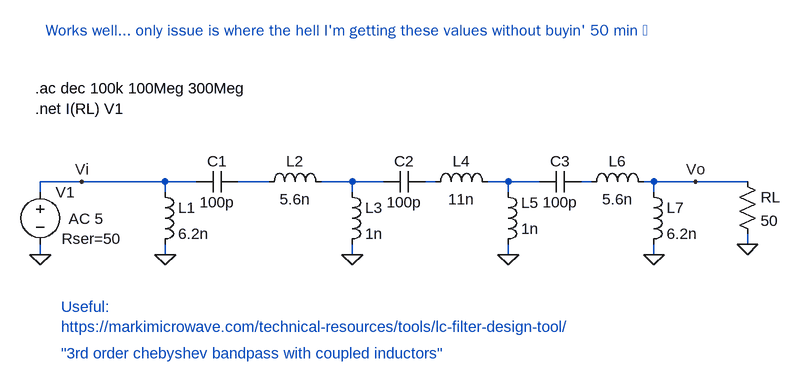
[diagram p0: schematic 2m_vhf_transmitter_bandpass_filter_v1.asc]
2m_vhf_transmitter_bandpass_filter_v1.asc, the LTspice schematic file:
Version 4.1
SHEET 1 1880 808
WIRE 160 528 96 528
WIRE 288 528 160 528
WIRE 336 528 288 528
WIRE 448 528 400 528
WIRE 576 528 528 528
WIRE 624 528 576 528
WIRE 704 528 688 528
WIRE 816 528 784 528
WIRE 864 528 816 528
WIRE 944 528 928 528
WIRE 1040 528 1024 528
WIRE 1104 528 1040 528
WIRE 1184 528 1104 528
WIRE 96 544 96 528
WIRE 288 544 288 528
WIRE 576 544 576 528
WIRE 816 544 816 528
WIRE 1040 544 1040 528
WIRE 1184 624 1184 608
WIRE 96 640 96 624
WIRE 288 640 288 624
WIRE 576 640 576 624
WIRE 816 640 816 624
WIRE 1040 640 1040 624
FLAG 96 640 0
FLAG 1184 624 0
FLAG 160 528 Vi
FLAG 1104 528 Vo
FLAG 288 640 0
FLAG 576 640 0
FLAG 816 640 0
FLAG 1040 640 0
SYMBOL voltage 96 528 R0
WINDOW 123 44 57 Left 2
WINDOW 39 33 88 Left 2
SYMATTR InstName V1
SYMATTR Value ""
SYMATTR Value2 AC 5
SYMATTR SpiceLine Rser=50
SYMBOL res 1168 512 R0
SYMATTR InstName RL
SYMATTR Value 50
SYMBOL ind 272 528 R0
SYMATTR InstName L1
SYMATTR Value 6.2n
SYMBOL cap 400 512 R90
WINDOW 0 0 32 VBottom 2
WINDOW 3 32 32 VTop 2
SYMATTR InstName C1
SYMATTR Value 100p
SYMBOL ind 432 544 R270
WINDOW 0 32 56 VTop 2
WINDOW 3 5 56 VBottom 2
SYMATTR InstName L2
SYMATTR Value 5.6n
SYMBOL ind 560 528 R0
SYMATTR InstName L3
SYMATTR Value 1n
SYMBOL cap 688 512 R90
WINDOW 0 0 32 VBottom 2
WINDOW 3 32 32 VTop 2
SYMATTR InstName C2
SYMATTR Value 100p
SYMBOL ind 800 544 M270
WINDOW 0 32 56 VTop 2
WINDOW 3 5 56 VBottom 2
SYMATTR InstName L4
SYMATTR Value 11n
SYMBOL ind 800 640 M180
WINDOW 0 36 80 Left 2
WINDOW 3 36 40 Left 2
SYMATTR InstName L5
SYMATTR Value 1n
SYMBOL cap 928 512 R90
WINDOW 0 0 32 VBottom 2
WINDOW 3 32 32 VTop 2
SYMATTR InstName C3
SYMATTR Value 100p
SYMBOL ind 928 544 R270
WINDOW 0 32 56 VTop 2
WINDOW 3 5 56 VBottom 2
SYMATTR InstName L6
SYMATTR Value 5.6n
SYMBOL ind 1024 528 R0
SYMATTR InstName L7
SYMATTR Value 6.2n
TEXT 88 384 Left 2 !.ac dec 100k 100Meg 300Meg
TEXT 88 416 Left 2 !.net I(RL) V1
TEXT 128 720 Left 2 ;Useful:\nhttps://markimicrowave.com/technical-resources/tools/lc-filter-design-tool/
TEXT 104 296 Left 2 ;Works well... only issue is where the hell I'm getting these values without buyin' 50 min 💀
TEXT 128 792 Left 2 ;"3rd order chebyshev bandpass with coupled inductors"

The netlist it stands for:
* 2m_vhf_transmitter_bandpass_filter_v1.asc
V1 Vi 0 AC 5 Rser=50
RL Vo 0 50
L1 Vi 0 6.2n
C1 N001 Vi 100p
L2 N001 N002 5.6n
L3 N002 0 1n
C2 N003 N002 100p
L4 N004 N003 11n
L5 0 N004 1n
C3 N005 N004 100p
L6 N005 Vo 5.6n
L7 Vo 0 6.2n
.ac dec 100k 100Meg 300Meg
.net I(RL) V1
* Useful:
* https://markimicrowave.com/technical-resources/tools/lc-filter-design-tool/
* Works well... only issue is where the hell I'm getting these values without buyin' 50 min 💀
* "3rd order chebyshev bandpass with coupled inductors"
.backanno
.end